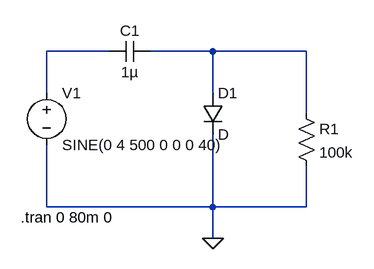
[diagram p0: schematic clamper.asc]
clamper.asc, the LTspice schematic file:
Version 4.1
SHEET 1 880 680
WIRE 176 16 80 16
WIRE 336 16 240 16
WIRE 480 16 336 16
WIRE 80 80 80 16
WIRE 336 80 336 16
WIRE 480 112 480 16
WIRE 80 256 80 160
WIRE 336 256 336 144
WIRE 336 256 80 256
WIRE 480 256 480 192
WIRE 480 256 336 256
WIRE 336 304 336 256
FLAG 336 304 0
SYMBOL voltage 80 64 R0
WINDOW 123 0 0 Left 0
WINDOW 39 0 0 Left 0
SYMATTR InstName V1
SYMATTR Value SINE(0 4 500 0 0 0 40)
SYMBOL cap 240 0 R90
WINDOW 0 0 32 VBottom 2
WINDOW 3 32 32 VTop 2
SYMATTR InstName C1
SYMATTR Value 1µ
SYMBOL res 464 96 R0
SYMATTR InstName R1
SYMATTR Value 100k
SYMBOL diode 320 80 R0
SYMATTR InstName D1
TEXT 40 272 Left 2 !.tran 0 80m 0

The netlist it stands for:
* clamper.asc
V1 N001 0 SINE(0 4 500 0 0 0 40)
C1 N002 N001 1µ
R1 N002 0 100k
D1 N002 0 D
.model D D
.lib standard.dio
.tran 0 80m 0
.backanno
.end